# EAGLE design cpu2-b (EAGLE 4.13)
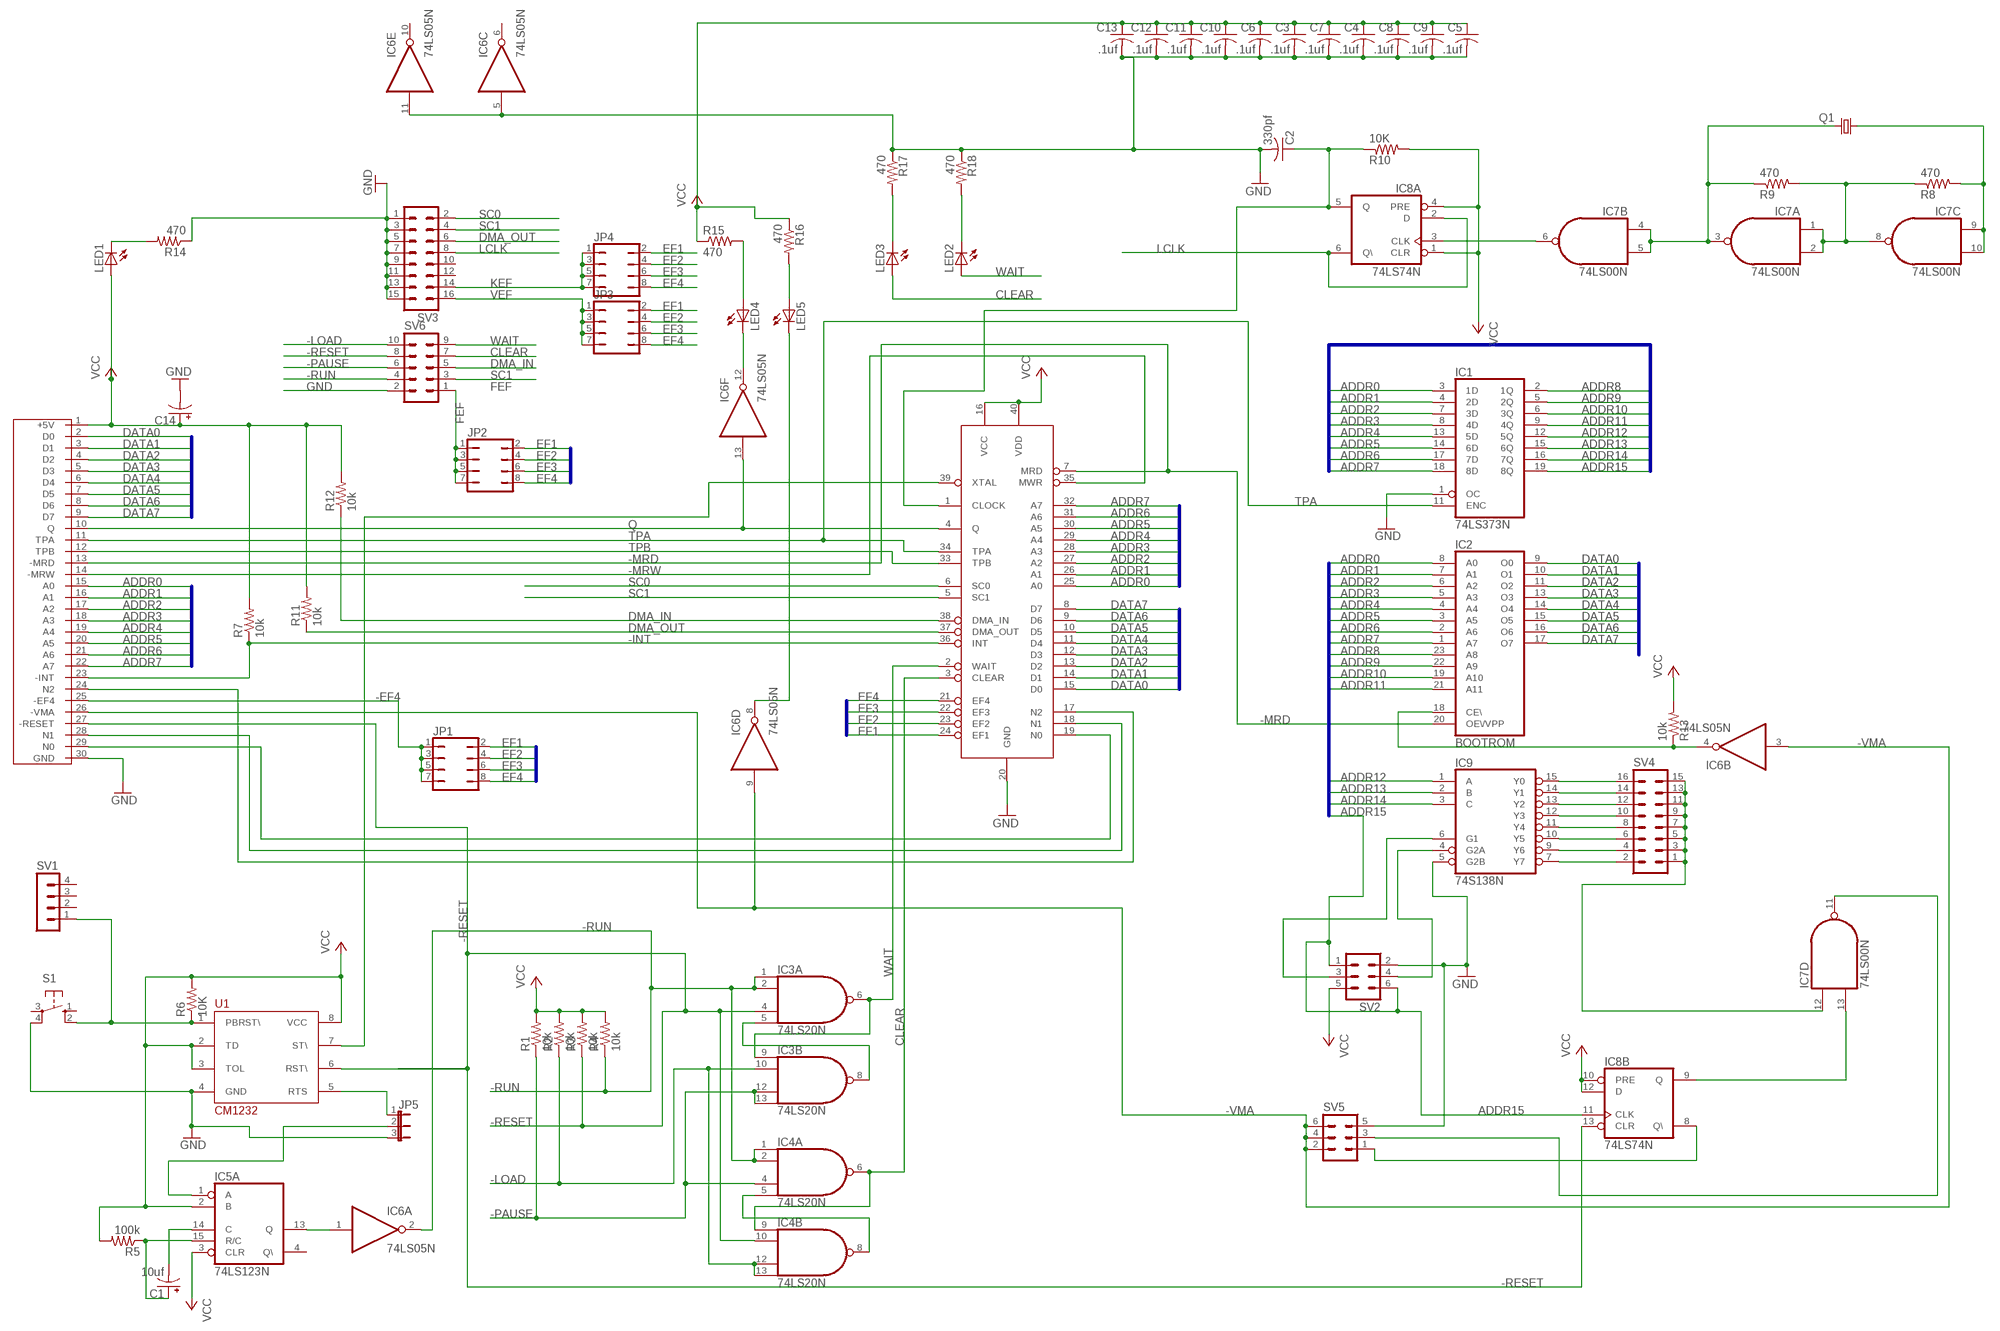
[diagram p0: schematic, sheet 1]

## Parts
C1  10uf  CPOL-USE2.5-7  [E2,5-7]
C2  330pf  C-US025-025X050  [C025-025X050]
C3  .1uf  C-US025-050X050  [C025-050X050]
C4  .1uf  C-US025-050X050  [C025-050X050]
C5  .1uf  C-US025-050X050  [C025-050X050]
C6  .1uf  C-US025-050X050  [C025-050X050]
C7  .1uf  C-US025-050X050  [C025-050X050]
C8  .1uf  C-US025-050X050  [C025-050X050]
C9  .1uf  C-US025-050X050  [C025-050X050]
C10  .1uf  C-US025-050X050  [C025-050X050]
C11  .1uf  C-US025-050X050  [C025-050X050]
C12  .1uf  C-US025-050X050  [C025-050X050]
C13  .1uf  C-US025-050X050  [C025-050X050]
C14  CPOL-USE2.5-7  [E2,5-7]
IC1  74LS373N  [DIL20]
IC2  BOOTROM  2732  [DIL24]
IC3  74LS20N  [DIL14]
IC4  74LS20N  [DIL14]
IC5  74LS123N  [DIL16]
IC6  74LS05N  [DIL14]
IC7  74LS00N  [DIL14]
IC8  74LS74N  [DIL14]
IC9  74S138N  [DIL16]
JP1  JP4Q  [JP4Q]
JP2  JP4Q  [JP4Q]
JP3  JP4Q  [JP4Q]
JP4  JP4Q  [JP4Q]
JP5  JP2E  [JP2]
LED1  LED5MM  [LED5MM]
LED2  LED5MM  [LED5MM]
LED3  LED5MM  [LED5MM]
LED4  LED5MM  [LED5MM]
LED5  LED5MM  [LED5MM]
Q1  CRYTALHC49U70  [HC49U70]
R1  10k  R-US_0207/2V  [0207/2V]
R2  10k  R-US_0207/2V  [0207/2V]
R3  10k  R-US_0207/2V  [0207/2V]
R4  10k  R-US_0207/2V  [0207/2V]
R5  100k  R-US_0207/2V  [0207/2V]
R6  10K  R-US_0207/2V  [0207/2V]
R7  10k  R-US_0207/2V  [0207/2V]
R8  470  R-US_0207/2V  [0207/2V]
R9  470  R-US_0207/2V  [0207/2V]
R10  10K  R-US_0207/2V  [0207/2V]
R11  10k  R-US_0207/2V  [0207/2V]
R12  10k  R-US_0207/2V  [0207/2V]
R13  10k  R-US_0207/2V  [0207/2V]
R14  470  R-US_0207/7  [0207/7]
R15  470  R-US_0207/7  [0207/7]
R16  470  R-US_0207/7  [0207/7]
R17  470  R-US_0207/7  [0207/7]
R18  470  R-US_0207/7  [0207/7]
S1  10-XX  [B3F-10XX]
SV1  MA04-1  [MA04-1]
SV2  MA03-2  [MA03-2]
SV3  MA08-2  [MA08-2]
SV4  MA08-2  [MA08-2]
SV5  MA03-2  [MA03-2]
SV6  MA05-2  [MA05-2]
U1  CM1232  [DIP-8]
U$1  CDP1802BCECDP1802BCE  [DIL40]
U$2  C30  [C30]

## Nets
-EF4: JP1.1 JP1.3 JP1.5 JP1.7 U$2.25(-EF4)
-INT: R7.1 U$1.36(INT) U$2.23(-INT)
-LOAD: IC3.10(B:I1) IC4.12(B:I2) IC4.13(B:I3) R2.1 SV6.10
-MRD: IC2.20(OE\/VPP) U$1.7(MRD) U$2.13(-MRD)
-MRW: U$1.35(MWR) U$2.14(-MRW)
-PAUSE: IC3.12(B:I2) IC3.13(B:I3) IC4.4(A:I2) R1.1 SV6.6
-RESET: IC3.4(A:I2) IC4.10(B:I1) IC8.13(B:CLR) R3.1 SV6.8 U1.6(RST\) U$2.27(-RESET)
-RUN: IC3.1(A:I0) IC3.2(A:I1) IC4.1(A:I0) IC4.2(A:I1) IC6.2(A:O) R4.1 SV6.4
-VMA: IC6.3(B:I) IC6.9(D:I) SV5.2 SV5.4 SV5.6 U$2.26(-VMA)
ADDR0: IC1.3(1D) IC2.8(A0) U$1.25(A0) U$2.15(A0)
ADDR1: IC1.4(2D) IC2.7(A1) U$1.26(A1) U$2.16(A1)
ADDR2: IC1.7(3D) IC2.6(A2) U$1.27(A2) U$2.17(A2)
ADDR3: IC1.8(4D) IC2.5(A3) U$1.28(A3) U$2.18(A3)
ADDR4: IC1.13(5D) IC2.4(A4) U$1.29(A4) U$2.19(A4)
ADDR5: IC1.14(6D) IC2.3(A5) U$1.30(A5) U$2.20(A5)
ADDR6: IC1.17(7D) IC2.2(A6) U$1.31(A6) U$2.21(A6)
ADDR7: IC1.18(8D) IC2.1(A7) U$1.32(A7) U$2.22(A7)
ADDR8: IC1.2(1Q) IC2.23(A8)
ADDR9: IC1.5(2Q) IC2.22(A9)
ADDR10: IC1.6(3Q) IC2.19(A10)
ADDR11: IC1.9(4Q) IC2.21(A11)
ADDR12: IC1.12(5Q) IC9.1(A)
ADDR13: IC1.15(6Q) IC9.2(B)
ADDR14: IC1.16(7Q) IC9.3(C)
ADDR15: IC1.19(8Q) IC8.11(B:CLK) SV2.1 SV2.6
CLEAR: IC4.6(A:O) IC4.9(B:I0) LED3.A SV6.7 U$1.3(CLEAR)
DATA0: IC2.9(O0) U$1.15(D0) U$2.2(D0)
DATA1: IC2.10(O1) U$1.14(D1) U$2.3(D1)
DATA2: IC2.11(O2) U$1.13(D2) U$2.4(D2)
DATA3: IC2.13(O3) U$1.12(D3) U$2.5(D3)
DATA4: IC2.14(O4) U$1.11(D4) U$2.6(D4)
DATA5: IC2.15(O5) U$1.10(D5) U$2.7(D5)
DATA6: IC2.16(O6) U$1.9(D6) U$2.8(D6)
DATA7: IC2.17(O7) U$1.8(D7) U$2.9(D7)
DMA_IN: R12.1 SV6.5 U$1.38(DMA_IN)
DMA_OUT: R11.1 SV3.6 U$1.37(DMA_OUT)
EF1: JP1.2 JP2.2 JP3.2 JP4.2 U$1.24(EF1)
EF2: JP1.4 JP2.4 JP3.4 JP4.4 U$1.23(EF2)
EF3: JP1.6 JP2.6 JP3.6 JP4.6 U$1.22(EF3)
EF4: JP1.8 JP2.8 JP3.8 JP4.8 U$1.21(EF4)
FEF: JP2.1 JP2.3 JP2.5 JP2.7 SV6.1
GND: C2.2 C3.2 C4.2 C5.2 C6.2 C7.2 C8.2 C9.2 C10.2 C11.2 C12.2 C13.2 C14.- IC1.1(OC) IC6.5(C:I) IC6.11(E:I) IC9.5(G2B) JP5.3 R14.1 R17.1 R18.1 S1.4(P1) SV2.2 SV3.1 SV3.3 SV3.5 SV3.7 SV3.9 SV3.11 SV3.13 SV3.15 SV5.5 SV6.2 U1.4(GND) U$1.20(GND) U$2.30(GND)
KEF: JP4.1 JP4.3 JP4.5 JP4.7 SV3.14
LCLK: IC8.2(A:D) IC8.6(A:Q\) SV3.8
N0: U$1.19(N0) U$2.29(N0)
N1: U$1.18(N1) U$2.28(N1)
N2: U$1.17(N2) U$2.24(N2)
N$1: IC7.11(D:O) SV5.3
N$2: R6.1 S1.2(S1) SV1.1 U1.1(PBRST\)
N$3: IC2.18(CE\) IC6.4(B:O) R13.1
N$4: IC7.13(D:I1) IC8.9(B:Q)
N$5: LED1.K(C) R14.2
N$6: IC8.8(B:Q\) SV5.1
N$7: IC6.12(F:O) LED4.K(C)
N$8: LED4.A R15.2
N$9: LED3.K(C) R17.2
N$10: LED2.K(C) R18.2
N$11: IC5.13(A:Q) IC6.1(A:I)
N$12: IC5.1(A:A) JP5.2
N$13: LED5.A R16.2
N$14: U1.7(ST\) U$1.39(XTAL)
N$16: IC7.1(A:I0) IC7.2(A:I1) IC7.8(C:O) R8.1 R9.2
N$17: C1.+ IC5.15(A:R/C) R5.1
N$18: IC7.3(A:O) IC7.4(B:I0) IC7.5(B:I1) Q1.2 R9.1
N$19: C1.- IC5.14(A:C)
N$20: IC9.4(G2A) SV2.4
N$21: IC7.9(C:I0) IC7.10(C:I1) Q1.1 R8.2
N$22: IC3.5(A:I3) IC3.8(B:O)
N$23: IC7.6(B:O) IC8.3(A:CLK)
N$24: IC4.5(A:I3) IC4.8(B:O)
N$25: IC6.8(D:O) LED5.K(C)
N$26: JP5.1 U1.5(RTS)
N$27: C2.1 IC8.5(A:Q) R10.1 U$1.1(CLOCK)
N$29: IC9.15(Y0) SV4.16
N$30: IC9.14(Y1) SV4.14
N$31: IC9.13(Y2) SV4.12
N$32: IC9.12(Y3) SV4.10
N$33: IC9.11(Y4) SV4.8
N$34: IC9.10(Y5) SV4.6
N$35: IC9.9(Y6) SV4.4
N$36: IC9.7(Y7) SV4.2
N$37: IC7.12(D:I0) SV4.1 SV4.3 SV4.5 SV4.7 SV4.9 SV4.11 SV4.13 SV4.15
N$38: IC9.6(G1) SV2.3
Q: IC6.13(F:I) U$1.4(Q) U$2.10(Q)
SC0: SV3.2 U$1.6(SC0)
SC1: SV3.4 SV6.3 U$1.5(SC1)
TPA: IC1.11(ENC) U$1.34(TPA) U$2.11(TPA)
TPB: U$1.33(TPB) U$2.12(TPB)
VCC: C3.1 C4.1 C5.1 C6.1 C7.1 C8.1 C9.1 C10.1 C11.1 C12.1 C13.1 C14.+ IC5.2(A:B) IC5.3(A:CLR) IC8.1(A:CLR) IC8.4(A:PRE) IC8.10(B:PRE) IC8.12(B:D) LED1.A R1.2 R2.2 R3.2 R4.2 R5.2 R6.2 R7.2 R10.2 R11.2 R12.2 R13.2 R15.1 R16.1 SV2.5 U1.2(TD) U1.3(TOL) U1.8(VCC) U$1.16(VCC) U$1.40(VDD) U$2.1(+5V)
VEF: JP3.1 JP3.3 JP3.5 JP3.7 SV3.16
WAIT: IC3.6(A:O) IC3.9(B:I0) LED2.A SV6.9 U$1.2(WAIT)
Unconnected: IC5.4(A:Q\) IC5.5(B:Q) IC5.6(B:C) IC5.7(B:R/C) IC5.9(B:A) IC5.10(B:B) IC5.11(B:CLR) IC5.12(B:Q\) IC6.6(C:O) IC6.10(E:O) S1.1(S) S1.3(P) SV1.2 SV1.3 SV1.4 SV3.10 SV3.12

## Buses
DATA[0..7]
ADDR[0..15]
EF[1..4]

## Power pins joined to a net without a drawn wire
GND: IC1.10(GND) IC2.12(GND) IC3.7(P:GND) IC4.7(P:GND) IC5.8(P:GND) IC6.7(P:GND) IC7.7(P:GND) IC8.7(P:GND) IC9.8(GND)
VCC: IC1.20(VCC) IC2.24(VCC) IC3.14(P:VCC) IC4.14(P:VCC) IC5.16(P:VCC) IC6.14(P:VCC) IC7.14(P:VCC) IC8.14(P:VCC) IC9.16(VCC)

## Library data of the parts
C1 C14 = rcl:CPOL-US: POLARIZED CAPACITOR, American symbol
C2-C13 = rcl:C-US: CAPACITOR, American symbol
IC1 = 74xx-us:74*373: Octal D type transparent LATCH, edge triggered
IC2 = memory:2732: MEMORY
IC3 IC4 = 74xx-us:74*20: Dual 4-input NAND gate
IC5 = 74xx-us:74*123: Retriggerable monostable MULTIVIBRATOR
IC6 = 74xx-us:74*05: Hex INVERTER, open collector
IC7 = 74xx-us:74*00: Quad 2-input NAND gate
IC8 = 74xx-us:74*74: Dual D type positive edge triggered FLIP FLOP, preset and clear
IC9 = 74xx-us:74*138: 3-line to 8-line DECODER/DEMULTIPLEXER
JP1-JP4 = jumper:JP4Q: JUMPER
JP5 = jumper:JP2E: JUMPER
LED1-LED5 = led:LED: LED OSRAM: - CHIPLED LG R971, LG N971, LY N971, LG Q971, LY Q971, LO R971, LY R971 LH N974, LH R974 LS Q976, LO Q976, LY Q976 LO Q996 - Hyper CHIPLED LW Q18S LB Q993, LB Q99A, LB R99A - SideLED LS A670, LO A670, LY A670, LG A670, LP A670 LB A673, LV A673, LT A673, LW A673 LH A674 LY A675 LS A676, LA A676, LO A676, LY A676, LW A676 LS A679, LY A679, LG A679 - Hyper Micro SIDELED® LS Y876, LA Y876, LO Y876, LY Y876 LT Y87S - SmartLED LW L88C, LW L88S LB L89C, LB L89S, LG L890 LS L89K, LO L89K, LY L89K LS L896, LA L896, LO L896, LY L896 - TOPLED LS T670, LO T670, LY T670, LG T670, LP T670 LSG T670, LSP T670, LSY T670, LOP T670, LYG T670 LG T671, LOG T671, LSG T671 LB T673, LV T673, LT T673, LW T673 LH T674 LS T676, LA T676, LO T676, LY T676, LB T676, LH T676, LSB T676, LW T676 LB T67C, LV T67C, LT T67C, LS T67K, LO T67K, LY T67K, LW E67C LS E67B, LA E67B, LO E67B, LY E67B, LB E67C, LV E67C, LT E67C LW T67C LS T679, LY T679, LG T679 LS T770, LO T770, LY T770, LG T770, LP T770 LB T773, LV T773, LT T773, LW T773 LH T774 LS E675, LA E675, LY E675, LS T675 LS T776, LA T776, LO T776, LY T776, LB T776 LHGB T686 LT T68C, LB T68C - Hyper Mini TOPLED® LB M676 - Mini TOPLED Santana® LG M470 LS M47K, LO M47K, LY M47K Source: http://www.osram.convergy.de/
Q1 = crystal:CRYTAL: CRYSTAL
R1-R18 = rcl:R-US_: RESISTOR, American symbol
S1 = switch-omron:10-XX: OMRON SWITCH
SV1 = con-lstb:MA04-1: PIN HEADER
SV2 SV5 = con-lstb:MA03-2: PIN HEADER
SV3 SV4 = con-lstb:MA08-2: PIN HEADER
SV6 = con-lstb:MA05-2: PIN HEADER
U1 = 65xxx:CM1232: CM1232 CMOS Microprocessor Monitor
U$1 = cdp:CDP1802BCE
U$2 = k1:C30

## Board
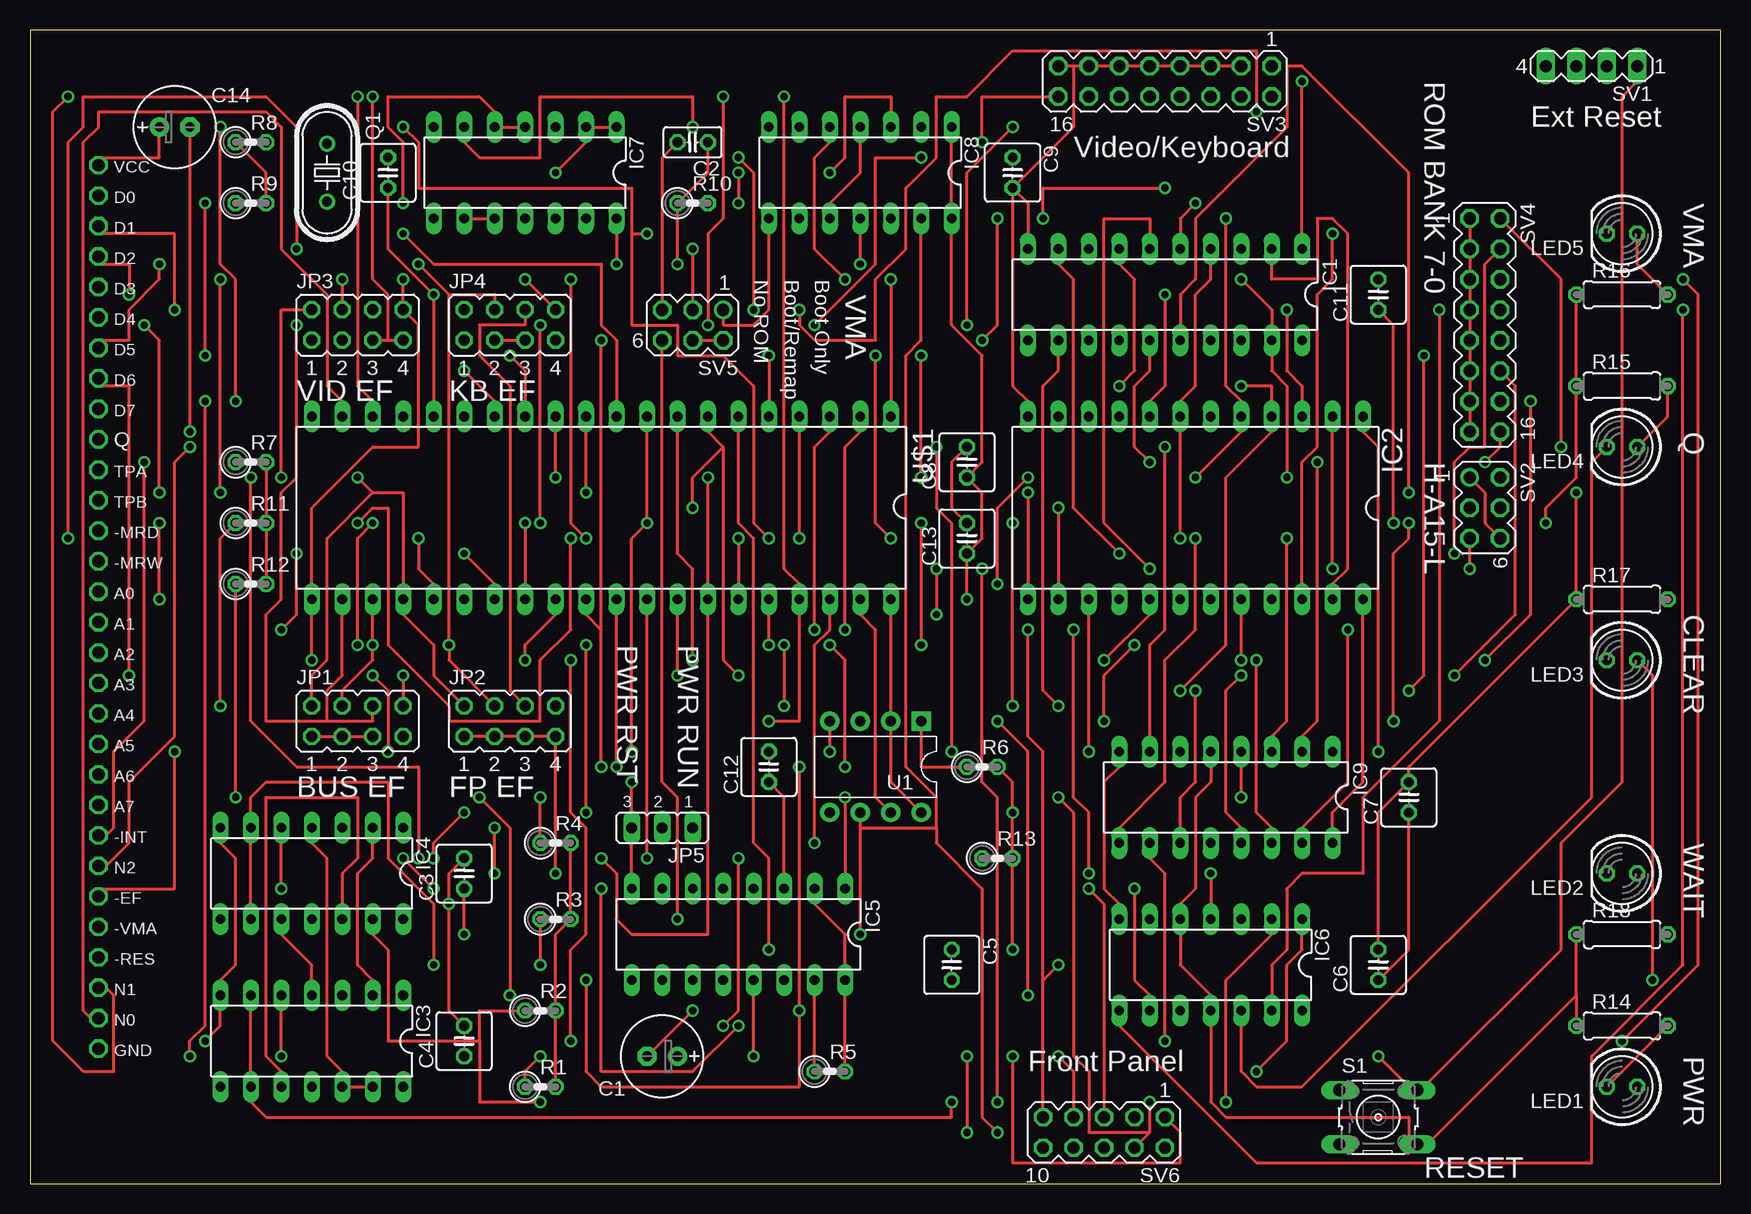
[diagram p1: board, top side]
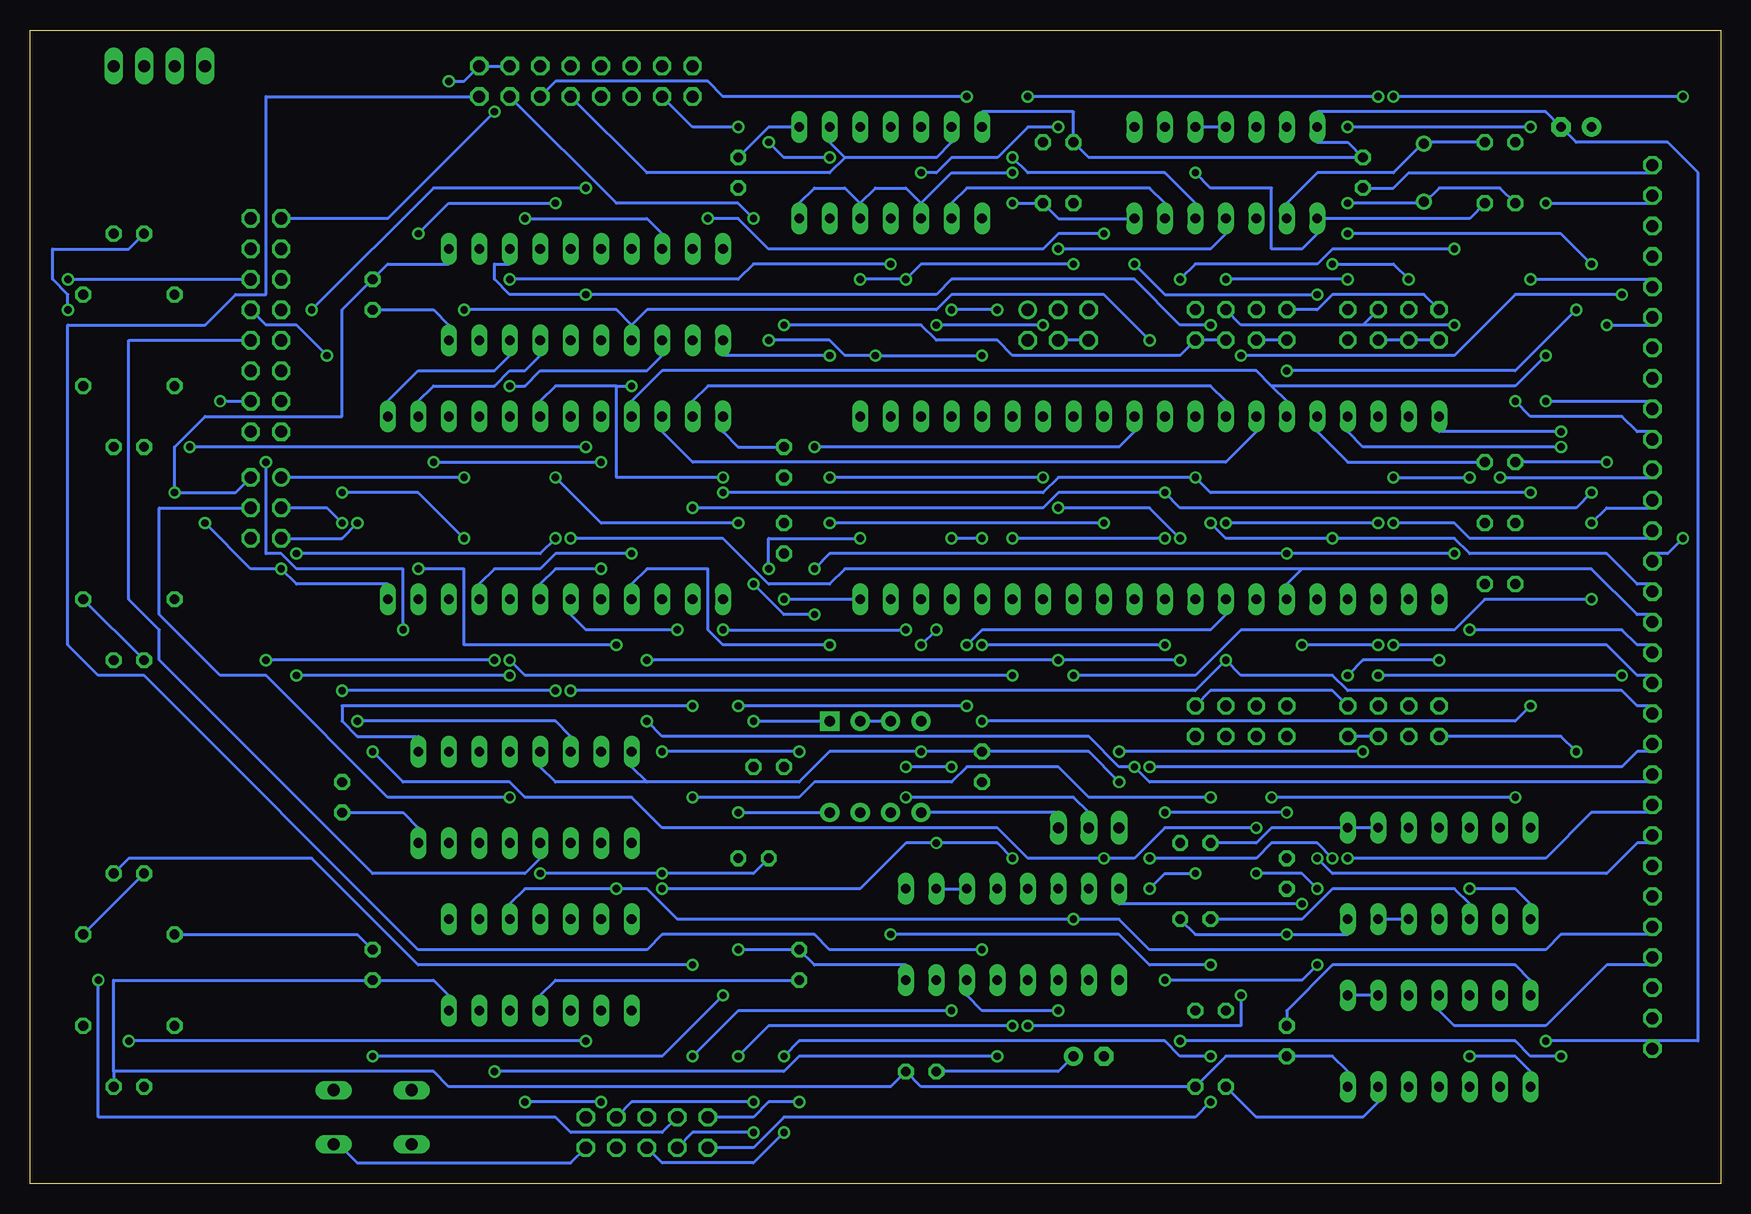
[diagram p2: board, bottom side, seen from below]

Size 140.95 x 96.19 mm. Coordinates in mm from the lower left corner, seen from the top.
Outline: 0,0 140.95,0 140.95,96.19 0,96.19 0,0
Copper layers (1*16): Top 0.035mm / dielectric 1.5mm / Bottom 0.035mm
Design rules "default": minimum track width 10mil, minimum drill 24mil, track to track 8mil, track to pad 8mil, pad to pad 8mil, via to via 8mil, smd to smd 8mil, copper to edge 40mil, drill to drill 8mil, minimum pad ring 10mil, minimum via ring 8mil, stop-mask expansion 4mil, vias tented up to drill 0mil, thermal gap 10mil
tRestrict: area 0.6,0.5 to 76.8,4.3; area 0.6,91.9 to 76.8,95.7
bRestrict: area 0.6,0.5 to 76.8,4.3; area 0.6,91.9 to 76.8,95.7

### Footprints (pad centres in the part's own frame; a part is rotated, then mirrored left to right if it is on the bottom)
E2,5-7 = drill 0.813 pad 1.6 round: + -1.27,0 | drill 0.813 pad 1.6 octagon: - 1.27,0
C025-025X050 = drill 0.813 octagon: 1 -1.27,0; 2 1.27,0
C025-050X050 = drill 0.813 octagon: 1 -1.27,0; 2 1.27,0
DIL20 = drill 0.813 long: 1 -11.43,-3.81; 2 -8.89,-3.81; 3 -6.35,-3.81; 4 -3.81,-3.81; 5 -1.27,-3.81; 6 1.27,-3.81; 7 3.81,-3.81; 8 6.35,-3.81; 9 8.89,-3.81; 10 11.43,-3.81; 11 11.43,3.81; 12 8.89,3.81; 13 6.35,3.81; 14 3.81,3.81; 15 1.27,3.81; 16 -1.27,3.81; 17 -3.81,3.81; 18 -6.35,3.81; 19 -8.89,3.81; 20 -11.43,3.81
DIL24 = drill 0.813 long: 1 -13.97,-7.62; 2 -11.43,-7.62; 3 -8.89,-7.62; 4 -6.35,-7.62; 5 -3.81,-7.62; 6 -1.27,-7.62; 7 1.27,-7.62; 8 3.81,-7.62; 9 6.35,-7.62; 10 8.89,-7.62; 11 11.43,-7.62; 12 13.97,-7.62; 13 13.97,7.62; 14 11.43,7.62; 15 8.89,7.62; 16 6.35,7.62; 17 3.81,7.62; 18 1.27,7.62; 19 -1.27,7.62; 20 -3.81,7.62; 21 -6.35,7.62; 22 -8.89,7.62; 23 -11.43,7.62; 24 -13.97,7.62
DIL14 = drill 0.813 long: 1 -7.62,-3.81; 2 -5.08,-3.81; 3 -2.54,-3.81; 4 0,-3.81; 5 2.54,-3.81; 6 5.08,-3.81; 7 7.62,-3.81; 8 7.62,3.81; 9 5.08,3.81; 10 2.54,3.81; 11 0,3.81; 12 -2.54,3.81; 13 -5.08,3.81; 14 -7.62,3.81
DIL16 = drill 0.813 long: 1 -8.89,-3.81; 2 -6.35,-3.81; 3 -3.81,-3.81; 4 -1.27,-3.81; 5 1.27,-3.81; 6 3.81,-3.81; 7 6.35,-3.81; 8 8.89,-3.81; 9 8.89,3.81; 10 6.35,3.81; 11 3.81,3.81; 12 1.27,3.81; 13 -1.27,3.81; 14 -3.81,3.81; 15 -6.35,3.81; 16 -8.89,3.81
JP4Q = drill 0.914 octagon: 1 -3.81,-1.27; 2 -3.81,1.27; 3 -1.27,-1.27; 4 -1.27,1.27; 5 1.27,-1.27; 6 1.27,1.27; 7 3.81,-1.27; 8 3.81,1.27
JP2 = drill 0.914 long: 1 -2.54,0; 2 0,0; 3 2.54,0
LED5MM = drill 0.813 octagon: A -1.27,0; K 1.27,0
HC49U70 = drill 0.813 round: 1 -2.413,0; 2 2.413,0
0207/2V = drill 0.813 octagon: 1 -1.27,0; 2 1.27,0
0207/7 = drill 0.813 octagon: 1 -3.81,0; 2 3.81,0
B3F-10XX = drill 1.016 long: 1 -3.251,2.261; 2 3.251,2.261; 3 -3.251,-2.261; 4 3.251,-2.261
MA04-1 = drill 1.016 long: 1 -3.81,0; 2 -1.27,0; 3 1.27,0; 4 3.81,0
MA03-2 = drill 1.016 round: 1 -2.54,-1.27 | drill 1.016 octagon: 2 -2.54,1.27; 3 0,-1.27; 4 0,1.27; 5 2.54,-1.27; 6 2.54,1.27
MA08-2 = drill 1.016 octagon: 1 -8.89,-1.27; 2 -8.89,1.27; 3 -6.35,-1.27; 4 -6.35,1.27; 5 -3.81,-1.27; 6 -3.81,1.27; 7 -1.27,-1.27; 8 -1.27,1.27; 9 1.27,-1.27; 10 1.27,1.27; 11 3.81,-1.27; 12 3.81,1.27; 13 6.35,-1.27; 14 6.35,1.27; 15 8.89,-1.27; 16 8.89,1.27
MA05-2 = drill 1.016 octagon: 1 -5.08,-1.27; 2 -5.08,1.27; 3 -2.54,-1.27; 4 -2.54,1.27; 5 0,-1.27; 6 0,1.27; 7 2.54,-1.27; 8 2.54,1.27; 9 5.08,-1.27; 10 5.08,1.27
DIP-8 = drill 0.889 pad 1.6 square: 1 -2.54,-2.54 | drill 0.889 pad 1.6 round: 2 0,-2.54; 3 2.54,-2.54; 4 5.08,-2.54; 5 5.08,5.08; 6 2.54,5.08; 7 0,5.08; 8 -2.54,5.08
DIL40 = drill 0.813 long: 1 -24.13,-7.62; 2 -21.59,-7.62; 3 -19.05,-7.62; 4 -16.51,-7.62; 5 -13.97,-7.62; 6 -11.43,-7.62; 7 -8.89,-7.62; 8 -6.35,-7.62; 9 -3.81,-7.62; 10 -1.27,-7.62; 11 1.27,-7.62; 12 3.81,-7.62; 13 6.35,-7.62; 14 8.89,-7.62; 15 11.43,-7.62; 16 13.97,-7.62; 17 16.51,-7.62; 18 19.05,-7.62; 19 21.59,-7.62; 20 24.13,-7.62; 21 24.13,7.62; 22 21.59,7.62; 23 19.05,7.62; 24 16.51,7.62; 25 13.97,7.62; 26 11.43,7.62; 27 8.89,7.62; 28 6.35,7.62; 29 3.81,7.62; 30 1.27,7.62; 31 -1.27,7.62; 32 -3.81,7.62; 33 -6.35,7.62; 34 -8.89,7.62; 35 -11.43,7.62; 36 -13.97,7.62; 37 -16.51,7.62; 38 -19.05,7.62; 39 -21.59,7.62; 40 -24.13,7.62
C30 = drill 1.016 octagon: 1 -36.83,0; 2 -34.29,0; 3 -31.75,0; 4 -29.21,0; 5 -26.67,0; 6 -24.13,0; 7 -21.59,0; 8 -19.05,0; 9 -16.51,0; 10 -13.97,0; 11 -11.43,0; 12 -8.89,0; 13 -6.35,0; 14 -3.81,0; 15 -1.27,0; 16 1.27,0; 17 3.81,0; 18 6.35,0; 19 8.89,0; 20 11.43,0; 21 13.97,0; 22 16.51,0; 23 19.05,0; 24 21.59,0; 25 24.13,0; 26 26.67,0; 27 29.21,0; 28 31.75,0; 29 34.29,0; 30 36.83,0

### Placement (x,y rotation side)
C1  52.7,10.63 180 top
C2  55.24,86.83 180 top
C3  36.19,25.87 90 top
C4  36.19,11.9 90 top
C5  76.83,18.25 270 top
C6  112.39,18.25 90 top
C7  114.93,32.22 90 top
C8  78.1,60.16 90 top
C9  81.91,84.29 270 top
C10  29.84,84.29 90 top
C11  112.39,74.13 90 top
C12  61.59,34.76 90 top
C13  78.1,53.81 90 top
C14  12.06,88.1 0 top
IC1  94.61,74.13 180 top
IC2  97.15,56.35 180 top
IC3  23.49,11.9 180 top
IC4  23.49,25.87 180 top
IC5  59.05,20.79 180 top
IC6  98.42,18.25 180 top
IC7  41.27,84.29 180 top
IC8  69.21,84.29 180 top
IC9  99.69,32.22 180 top
JP1  27.3,38.57 0 top
JP2  40,38.57 0 top
JP3  27.3,71.59 0 top
JP4  40,71.59 0 top
JP5  52.7,29.68 180 top
LED1  132.71,8.09 180 top
LED2  132.71,25.87 180 top
LED3  132.71,43.65 180 top
LED4  132.71,61.43 180 top
LED5  132.71,79.21 180 top
Q1  24.76,84.29 270 top
R1  42.54,8.09 0 top
R2  42.54,14.44 0 top
R3  43.81,22.06 0 top
R4  43.81,28.41 0 top
R5  66.67,9.36 0 top
R6  79.37,34.76 0 top
R7  18.41,60.16 0 top
R8  18.41,86.83 0 top
R9  18.41,81.75 0 top
R10  55.24,81.75 0 top
R11  18.41,55.08 0 top
R12  18.41,50 0 top
R13  80.64,27.14 0 top
R14  132.71,13.17 0 top
R15  132.71,66.51 0 top
R16  132.71,74.13 0 top
R17  132.71,48.73 0 top
R18  132.71,20.79 0 top
S1  112.39,5.55 0 top
SV1  130.17,93.18 180 top
SV2  121.28,56.35 270 top
SV3  94.61,91.91 180 top
SV4  121.28,71.59 270 top
SV5  55.24,71.59 180 top
SV6  89.53,4.28 180 top
U1  71.75,36.03 180 top
U$1  47.62,56.35 180 top
U$2  5.71,48.09 270 top

### Tracks (layer width: path | path; a pad name or v marks a point on that pad's centre or on a via)
-EF4  (via drill 0.61)
  Top 0.254: JP1.1 JP1.3 JP1.5 | v12.06,36.03 12.06,24.6 5.71,24.6 U$2.25
  Bottom 0.254: JP1.5 JP1.7 | v12.06,36.03 13.33,37.3 JP1.1
-INT  (via drill 0.61)
  Top 0.254: v9.52,60.16 9.52,38.57 6.98,36.03 6.98,29.68 5.71,28.41 U$2.23 | v46.35,30.95 v46.35,44.92 | v36.19,30.95 33.65,28.41 v33.65,27.14 | v61.59,44.92 U$1.36
  Bottom 0.254: v9.52,60.16 R7.1 | v46.35,44.92 v61.59,44.92 | v36.19,30.95 v46.35,30.95 | v33.65,27.14 32.38,25.87 9.52,25.87 6.98,28.41 5.71,28.41 U$2.23
-LOAD  (via drill 0.61)
  Top 0.254: IC3.10 20.95,9.36 19.68,10.63 19.68,32.22 27.3,32.22 27.3,27.14 26.03,25.87 IC4.12 | R2.1 37.46,14.44 37.46,11.9 | 37.46,11.9 29.84,11.9 29.84,19.52 28.57,20.79 IC4.13 | v42.54,6.82 37.46,6.82 37.46,11.9
  Bottom 0.254: IC4.12 IC4.13 | SV6.10 80.64,3.01 78.1,5.55 43.81,5.55 v42.54,6.82
-MRD  (via drill 0.61)
  Top 0.254: v59.05,42.38 57.78,43.65 57.78,61.43 | 57.78,61.43 56.51,62.7 U$1.7 | v100.96,43.65 IC2.20 | v27.3,55.08 28.57,56.35 29.84,56.35 29.84,44.92 34.92,39.84 34.92,38.57 42.54,38.57 42.54,43.65 45.08,46.19 v45.08,53.81 | v55.24,56.35 55.24,58.89 57.78,61.43
  Bottom 0.254: v100.96,43.65 99.69,42.38 v59.05,42.38 | v27.3,55.08 22.22,55.08 20.95,53.81 5.71,53.81 U$2.13 | v45.08,53.81 47.62,56.35 v55.24,56.35
-MRW  (via drill 0.61)
  Top 0.254: v46.35,53.81 45.08,55.08 v45.08,75.4 | v22.22,77.94 22.22,88.1 19.68,90.64 4.44,90.64 4.44,88.1 3.17,86.83 v3.17,53.81 | v59.05,53.81 U$1.35
  Bottom 0.254: v46.35,53.81 v59.05,53.81 | v45.08,75.4 43.81,76.67 33.65,76.67 32.38,77.94 v22.22,77.94 | v3.17,53.81 4.44,52.54 5.71,52.54 U$2.14
-PAUSE  (via drill 0.61)
  Top 0.254: IC3.13 IC3.12 26.03,9.36 24.76,10.63 24.76,27.14 23.49,28.41 IC4.4 | v78.1,10.63 v78.1,4.28 | v42.54,10.63 41.27,9.36 R1.1
  Bottom 0.254: R1.1 38.73,5.55 29.84,5.55 28.57,6.82 IC3.13 | SV6.6 88.26,1.74 80.64,1.74 v78.1,4.28 | v78.1,10.63 76.83,11.9 46.35,11.9 45.08,10.63 v42.54,10.63
-RESET  (via drill 0.61)
  Top 0.254: IC4.10 20.95,20.79 23.49,18.25 IC3.4 | 75.56,29.68 75.56,32.22 73.02,34.76 73.02,69.05 74.29,70.32 IC8.13 | 69.21,29.68 75.56,29.68 | 69.21,29.68 U1.6 | v80.64,4.28 79.37,5.55 79.37,24.6 75.56,28.41 75.56,29.68 | R3.1 v42.54,18.25 | v69.21,20.79 69.21,29.68
  Bottom 0.254: R3.1 34.92,22.06 32.38,24.6 22.22,24.6 20.95,23.33 IC4.10 | U$2.27 5.71,18.25 9.52,18.25 14.6,13.17 22.22,13.17 23.49,14.44 IC3.4 | SV6.8 85.72,4.28 v80.64,4.28 | v42.54,18.25 47.62,18.25 50.16,20.79 v69.21,20.79
-RUN  (via drill 0.61)
  Top 0.254: IC3.2 28.57,16.98 27.3,18.25 27.3,25.87 28.57,27.14 IC4.2 | v99.69,6.82 99.69,16.98 103.5,20.79 IC6.2 | 93.34,4.28 v93.34,6.82 | 93.34,4.28 SV6.4 | R4.1 v42.54,32.22 | v85.72,32.22 86.99,30.95 86.99,10.63 88.26,9.36 88.26,4.28 93.34,4.28
  Bottom 0.254: IC3.2 IC3.1 | IC4.2 IC4.1 37.46,29.68 38.73,28.41 R4.1 | v93.34,6.82 v99.69,6.82 | v42.54,32.22 52.7,32.22 55.24,34.76 62.86,34.76 64.13,33.49 75.56,33.49 76.83,32.22 v85.72,32.22
-VMA  (via drill 0.61)
  Top 0.254: SV5.4 SV5.2 | v92.07,24.6 92.07,16.98 93.34,15.71 IC6.9 | SV5.6 52.7,33.49 53.97,32.22 v53.97,22.06
  Bottom 0.254: SV5.6 SV5.4 | IC6.3 100.96,23.33 99.69,24.6 v92.07,24.6 89.53,24.6 86.99,22.06 v53.97,22.06 50.16,22.06 47.62,19.52 14.6,19.52 13.33,20.79 5.71,20.79 U$2.26
ADDR0  (via drill 0.61)
  Top 0.254: v94.61,74.13 94.61,66.51 93.34,65.24 IC2.8 | v32.38,53.81 32.38,51.27 33.65,50 U$1.25 | v42.54,55.08 v42.54,71.59
  Bottom 0.254: IC1.3 100.96,76.67 102.23,76.67 102.23,75.4 100.96,74.13 v94.61,74.13 65.4,74.13 64.13,75.4 48.89,75.4 45.08,71.59 v42.54,71.59 | U$2.15 5.71,50 6.98,50 9.52,52.54 20.95,52.54 22.22,53.81 v32.38,53.81 41.27,53.81 v42.54,55.08
ADDR1  (via drill 0.61)
  Top 0.254: IC1.4 98.42,75.4 97.15,74.13 97.15,66.51 95.88,65.24 IC2.7 v95.88,53.81
  Bottom 0.254: 34.92,51.27 36.19,50 U$1.26 | 34.92,51.27 10.79,51.27 6.98,47.46 5.71,47.46 U$2.16 | v95.88,53.81 83.18,53.81 79.37,50 74.29,50 73.02,51.27 34.92,51.27
ADDR2  (via drill 0.61)
  Top 0.254: v90.8,66.51 92.07,67.78 92.07,75.4 90.8,76.67 IC1.7 | v36.19,52.54 38.73,50 U$1.27 | v22.22,52.54 22.22,47.46 v20.95,46.19 | v83.18,58.89 80.64,56.35 v80.64,50 | v75.56,51.27 v75.56,47.46
  Bottom 0.254: 92.07,66.51 v90.8,66.51 | 92.07,66.51 97.15,66.51 98.42,65.24 IC2.6 | v22.22,52.54 v36.19,52.54 74.29,52.54 v75.56,51.27 | v20.95,46.19 8.25,46.19 6.98,44.92 5.71,44.92 U$2.17 | 92.07,66.51 92.07,58.89 v83.18,58.89 | v80.64,50 78.1,47.46 v75.56,47.46
ADDR3  (via drill 0.61)
  Top 0.254: v99.69,80.48 99.69,66.51 100.96,65.24 IC2.5 100.96,62.7 v97.15,58.89 | v28.57,55.08 27.3,53.81 v27.3,44.92 | v41.27,55.08 U$1.28 | v81.91,39.84 v81.91,55.08 | v62.86,44.92 v62.86,39.84
  Bottom 0.254: v99.69,80.48 89.53,80.48 88.26,79.21 IC1.8 | v28.57,55.08 v41.27,55.08 | v27.3,44.92 9.52,44.92 6.98,42.38 5.71,42.38 U$2.18 | v97.15,58.89 93.34,55.08 v81.91,55.08 | v62.86,39.84 v81.91,39.84 | v62.86,44.92 61.59,46.19 42.54,46.19 41.27,47.46 U$1.28
ADDR4  (via drill 0.61)
  Top 0.254: v100.96,66.51 103.5,66.51 IC2.4 103.5,62.7 99.69,58.89 99.69,44.92 v95.88,41.11 | v41.27,43.65 41.27,44.92 43.81,47.46 U$1.29
  Bottom 0.254: v100.96,66.51 99.69,66.51 98.42,67.78 89.53,67.78 88.26,69.05 IC1.13 | U$2.19 5.71,39.84 6.98,39.84 8.25,41.11 31.11,41.11 32.38,42.38 40,42.38 v41.27,43.65 43.81,41.11 v95.88,41.11
ADDR5  (via drill 0.61)
  Top 0.254: v104.77,72.86 104.77,67.78 106.04,66.51 IC2.3 | 47.62,46.19 46.35,47.46 U$1.30 | v47.62,34.76 47.62,46.19 | 47.62,46.19 v47.62,70.32
  Bottom 0.254: 90.8,71.59 92.07,72.86 v104.77,72.86 | v47.62,34.76 8.25,34.76 6.98,36.03 5.71,36.03 U$2.20 | 90.8,71.59 89.53,72.86 65.4,72.86 64.13,74.13 51.43,74.13 v47.62,70.32 | 90.8,71.59 IC1.14
ADDR6  (via drill 0.61)
  Top 0.254: v48.89,34.76 U$1.31 | v92.07,44.92 89.53,42.38 v89.53,38.57 | v108.58,51.27 IC2.2
  Bottom 0.254: IC1.17 98.42,69.05 99.69,67.78 100.96,67.78 102.23,66.51 107.31,66.51 108.58,65.24 IC2.2 | U$2.21 5.71,33.49 47.62,33.49 v48.89,34.76 50.16,34.76 52.7,37.3 88.26,37.3 v89.53,38.57 | v108.58,51.27 104.77,51.27 104.77,44.92 v92.07,44.92
ADDR7  (via drill 0.61)
  Top 0.254: v112.39,36.03 112.39,61.43 111.12,62.7 IC2.1 | v51.43,27.14 U$1.32 | v31.11,27.14 v33.65,24.6 | v38.73,25.87 v38.73,29.68
  Bottom 0.254: v112.39,36.03 109.85,33.49 100.96,33.49 99.69,32.22 90.8,32.22 88.26,29.68 60.32,29.68 57.78,27.14 v51.43,27.14 48.89,27.14 46.35,29.68 v38.73,29.68 | IC1.18 100.96,69.05 102.23,67.78 108.58,67.78 111.12,65.24 IC2.1 | v31.11,27.14 14.6,27.14 10.79,30.95 5.71,30.95 U$2.22 | v33.65,24.6 34.92,25.87 v38.73,25.87
ADDR8
  Top 0.254: IC2.23 108.58,50 109.85,51.27 109.85,79.21 108.58,80.48 107.31,80.48 107.31,75.4 103.5,75.4 IC1.2
ADDR9  (via drill 0.61)
  Top 0.254: v108.58,79.21 108.58,75.4 107.31,74.13 107.31,61.43 106.04,60.16 IC2.22 | v97.15,81.75 95.88,80.48 IC1.5
  Bottom 0.254: v108.58,79.21 106.04,81.75 v97.15,81.75
ADDR10  (via drill 0.61)
  Top 0.254: v93.34,51.27 89.53,55.08 89.53,80.48 93.34,80.48 IC1.6
  Bottom 0.254: v93.34,51.27 97.15,51.27 98.42,50 IC2.19
ADDR11  (via drill 0.61)
  Top 0.254: v90.8,52.54 86.99,56.35 86.99,75.4 85.72,76.67 IC1.9
  Bottom 0.254: v90.8,52.54 97.15,52.54 98.42,51.27 102.23,51.27 103.5,50 IC2.21
ADDR12  (via drill 0.61)
  Top 0.254: v85.72,39.84 84.45,41.11 84.45,66.51 85.72,67.78 IC1.12
  Bottom 0.254: v85.72,39.84 114.93,39.84 114.93,38.57 113.66,37.3 108.58,37.3 IC9.1
ADDR13  (via drill 0.61)
  Top 0.254: v107.31,60.16 107.31,38.57 106.04,37.3 IC9.2 | v93.34,60.16 92.07,61.43 92.07,66.51 93.34,67.78 IC1.15
  Bottom 0.254: v107.31,60.16 v93.34,60.16
ADDR14  (via drill 0.61)
  Top 0.254: v104.77,53.81 104.77,38.57 103.5,37.3 IC9.3 | v114.93,57.62 114.93,84.29 106.04,93.18 104.77,93.18 104.77,88.1 97.15,80.48 97.15,75.4 95.88,74.13 IC1.16
  Bottom 0.254: v104.77,53.81 108.58,57.62 v114.93,57.62
ADDR15  (via drill 0.61)
  Top 0.254: SV2.6 121.28,55.08 121.28,57.62 SV2.1 | v100.96,75.4 103.5,72.86 IC1.19 103.5,67.78 104.77,66.51 v104.77,58.89 | v69.21,76.67 IC8.11
  Bottom 0.254: v69.21,76.67 80.64,76.67 81.91,75.4 v100.96,75.4 | v104.77,58.89 SV2.1
CLEAR  (via drill 0.61)
  Top 0.254: IC4.9 IC4.6 18.41,32.22 19.68,33.49 29.84,33.49 29.84,27.14 33.65,23.33 v33.65,18.25 | v65.4,46.19 65.4,61.43 66.67,62.7 U$1.3 | v66.67,44.92 67.94,43.65 v67.94,34.76 | v64.13,34.76 v64.13,14.44 64.13,8.09 47.62,8.09 46.35,9.36 v46.35,16.98 | v85.72,10.63 86.99,9.36 SV6.7 | LED3.A 135.25,42.38 v135.25,16.98
  Bottom 0.254: v66.67,44.92 v65.4,46.19 | v64.13,34.76 v67.94,34.76 | v64.13,14.44 81.91,14.44 v85.72,10.63 | v135.25,16.98 135.25,5.55 97.15,5.55 95.88,4.28 88.26,4.28 SV6.7 | v33.65,18.25 34.92,16.98 v46.35,16.98
DATA0  (via drill 0.61)
  Top 0.254: v14.6,69.05 v14.6,81.75
  Bottom 0.254: 37.46,66.51 38.73,67.78 88.26,67.78 90.8,65.24 IC2.9 | 37.46,66.51 36.19,65.24 U$1.15 | v14.6,81.75 5.71,81.75 U$2.2 | v14.6,69.05 17.14,66.51 37.46,66.51
DATA1  (via drill 0.61)
  Top 0.254: v12.06,72.86 12.06,79.21 5.71,79.21 U$2.3 | v36.19,67.78 38.73,65.24 U$1.14
  Bottom 0.254: U$1.14 38.73,62.7 41.27,60.16 85.72,60.16 88.26,62.7 IC2.10 | v12.06,72.86 17.14,67.78 v36.19,67.78
DATA2  (via drill 0.61)
  Top 0.254: v8.25,74.13 8.25,76.67 5.71,76.67 U$2.4 | v40,69.05 41.27,67.78 U$1.13
  Bottom 0.254: U$1.13 41.27,65.24 42.54,66.51 84.45,66.51 85.72,65.24 IC2.11 | v8.25,74.13 17.14,74.13 22.22,69.05 v40,69.05
DATA3  (via drill 0.61)
  Top 0.254: v43.81,58.89 U$1.12 | v83.18,57.62 IC2.13 | v15.87,57.62 v15.87,75.4
  Bottom 0.254: v83.18,57.62 56.51,57.62 55.24,58.89 v43.81,58.89 42.54,57.62 v15.87,57.62 | v15.87,75.4 5.71,75.4 U$2.5
DATA4  (via drill 0.61)
  Top 0.254: v46.35,57.62 U$1.11 | v85.72,56.35 IC2.14 | v9.52,71.59 10.79,70.32 v10.79,57.62
  Bottom 0.254: v85.72,56.35 56.51,56.35 55.24,57.62 v46.35,57.62 45.08,56.35 12.06,56.35 v10.79,57.62 | v9.52,71.59 5.71,71.59 U$2.6
DATA5  (via drill 0.61)
  Top 0.254: v76.83,36.03 76.83,55.08 75.56,56.35 v75.56,61.43 | v88.26,36.03 IC2.15 | v10.79,76.67 10.79,75.4 8.25,72.86 8.25,70.32 5.71,70.32 U$2.7 | v31.11,79.21 33.65,76.67 47.62,76.67 47.62,71.59 48.89,70.32 U$1.10
  Bottom 0.254: v76.83,36.03 v88.26,36.03 | v75.56,61.43 50.16,61.43 48.89,62.7 U$1.10 | v10.79,76.67 13.33,79.21 v31.11,79.21
DATA6  (via drill 0.61)
  Top 0.254: v74.29,55.08 v74.29,44.92 | U$1.9 v51.43,55.08 50.16,53.81 v50.16,36.03 | v8.25,42.38 8.25,66.51 5.71,66.51 U$2.8 | v28.57,42.38 29.84,41.11 v29.84,36.03
  Bottom 0.254: v51.43,55.08 v74.29,55.08 | v74.29,44.92 83.18,44.92 84.45,46.19 84.45,51.27 89.53,51.27 90.8,50 IC2.16 | v8.25,42.38 v28.57,42.38 | v29.84,36.03 v50.16,36.03
DATA7  (via drill 0.61)
  Top 0.254: v55.24,43.65 55.24,51.27 53.97,52.54 U$1.8 | v89.53,43.65 93.34,47.46 IC2.17 | v14.6,65.24 14.6,13.17 13.33,11.9 v13.33,10.63 | v45.08,11.9 45.08,19.52 46.35,20.79 46.35,29.68 45.08,30.95 v45.08,43.65
  Bottom 0.254: v89.53,43.65 v55.24,43.65 v45.08,43.65 | v14.6,65.24 5.71,65.24 U$2.9 | v13.33,10.63 15.87,10.63 17.14,11.9 v45.08,11.9
DMA_IN  (via drill 0.61)
  Top 0.254: v17.14,32.22 R12.1 | v37.46,32.22 40,29.68 v40,15.71 | v57.78,13.17 59.05,14.44 v59.05,27.14 | v65.4,28.41 65.4,44.92 66.67,46.19 U$1.38 | SV6.5 89.53,23.33 v88.26,24.6
  Bottom 0.254: v17.14,32.22 v37.46,32.22 | v40,15.71 40,13.17 v57.78,13.17 | v59.05,27.14 60.32,28.41 v65.4,28.41 67.94,28.41 71.75,24.6 v88.26,24.6
DMA_OUT  (via drill 0.61)
  Top 0.254: v62.86,90.64 62.86,51.27 64.13,50 U$1.37 64.13,38.57 v61.59,38.57 | R11.1 15.87,53.81 v15.87,39.84
  Bottom 0.254: v62.86,90.64 83.18,90.64 84.45,91.91 97.15,91.91 SV3.6 | v15.87,39.84 17.14,38.57 v61.59,38.57
EF1  (via drill 0.61)
  Top 0.254: JP2.2 33.65,42.38 33.65,44.92 31.11,47.46 U$1.24 31.11,57.62 28.57,57.62 | JP1.2 23.49,42.38 24.76,43.65 24.76,53.81 28.57,57.62 | JP3.2 20.95,72.86 v20.95,58.89 | 28.57,57.62 v27.3,58.89
  Bottom 0.254: JP3.2 24.76,74.13 32.38,74.13 33.65,72.86 JP4.2 | v27.3,58.89 v20.95,58.89
EF2  (via drill 0.61)
  Top 0.254: JP1.4 26.03,41.11 28.57,43.65 v28.57,44.92 U$1.23 | JP2.4 34.92,43.65 v34.92,44.92 34.92,74.13 | 34.92,74.13 38.73,74.13 JP4.4 | v26.03,75.4 JP3.4 | 34.92,74.13 v32.38,76.67
  Bottom 0.254: v26.03,75.4 27.3,76.67 v32.38,76.67 | v28.57,44.92 v34.92,44.92
EF3  (via drill 0.61)
  Top 0.254: 24.76,38.57 24.76,41.11 26.03,42.38 U$1.22 | 24.76,38.57 28.57,38.57 JP1.6 | JP2.6 40,41.11 40,66.51 37.46,69.05 37.46,71.59 41.27,71.59 JP4.6 | 24.76,38.57 19.68,38.57 19.68,47.46 20.95,48.73 20.95,57.62 22.22,58.89 v22.22,71.59
  Bottom 0.254: 29.84,71.59 JP3.6 | 29.84,71.59 40,71.59 JP4.6 | v22.22,71.59 29.84,71.59
EF4  (via drill 0.61)
  Top 0.254: v41.27,75.4 JP4.8 | v31.11,75.4 JP3.8 32.38,71.59 32.38,61.43 28.57,61.43 23.49,56.35 U$1.21 v23.49,43.65 | v31.11,42.38 JP1.8
  Bottom 0.254: JP1.8 32.38,41.11 42.54,41.11 JP2.8 | v31.11,75.4 v41.27,75.4 | v31.11,42.38 29.84,43.65 v23.49,43.65
FEF  (via drill 0.61)
  Top 0.254: JP2.1 JP2.3 JP2.5 JP2.7 v43.81,25.87 | SV6.1 95.88,4.28 95.88,1.74 81.91,1.74 v81.91,10.63 | v59.05,13.17 55.24,9.36 47.62,9.36 v47.62,24.6
  Bottom 0.254: v81.91,10.63 79.37,13.17 v59.05,13.17 | v47.62,24.6 46.35,25.87 v43.81,25.87
GND  (via drill 0.61)
  Top 0.254: SV5.5 52.7,85.56 C2.2 | C14.- v13.33,62.7 | C13.2 76.83,56.35 76.83,60.16 C8.2 | C9.2 83.18,81.75 IC1.10 | 86.99,93.18 SV3.13 SV3.11 SV3.9 SV3.7 SV3.5 SV3.3 | 86.99,93.18 SV3.15 | C9.2 86.99,88.1 86.99,93.18 | C9.2 81.91,66.51 83.18,65.24 IC2.12 | IC4.7 15.87,28.41 17.14,27.14 17.14,18.25 15.87,16.98 IC3.7 15.87,13.17 v14.6,11.9 | IC5.8 JP5.3 v50.16,33.49 | C4.2 34.92,14.44 v34.92,23.33 34.92,25.87 C3.2 | IC6.7 90.8,23.33 89.53,24.6 89.53,33.49 90.8,34.76 IC9.8 | v66.67,36.03 U1.4 | IC9.5 98.42,33.49 97.15,32.22 97.15,24.6 95.88,23.33 IC6.5 95.88,18.25 98.42,15.71 IC6.11 98.42,6.82 99.69,5.55 114.93,5.55 114.93,3.01 S1.4 116.2,3.01 128.9,15.71 | C6.2 112.39,30.95 C7.2 114.93,34.76 R17.1 v128.9,57.62 | 128.9,15.71 R18.1 | 128.9,15.71 R14.1 | IC1.1 v106.04,91.91
  Bottom 0.254: IC8.7 61.59,89.37 53.97,89.37 C2.2 52.7,85.56 C10.2 31.11,86.83 33.65,86.83 IC7.7 33.65,89.37 14.6,89.37 C14.- 12.06,86.83 4.44,86.83 1.9,84.29 1.9,11.9 5.71,11.9 | v13.33,62.7 23.49,62.7 U$1.20 | C8.2 81.91,61.43 83.18,62.7 IC2.12 | SV3.3 SV3.1 104.77,91.91 v106.04,91.91 | 5.71,11.9 v14.6,11.9 | v34.92,23.33 50.16,23.33 IC5.8 | C4.2 36.19,14.44 32.38,18.25 17.14,18.25 15.87,16.98 IC3.7 | C5.2 97.15,16.98 98.42,15.71 IC6.11 | 89.53,33.49 76.83,33.49 74.29,36.03 v66.67,36.03 C12.2 52.7,36.03 v50.16,33.49 | 89.53,33.49 90.8,34.76 IC9.8 | 89.53,33.49 97.15,33.49 98.42,34.76 IC9.5 | SV6.2 95.88,1.74 113.66,1.74 114.93,3.01 S1.4 | IC1.1 106.04,76.67 111.12,76.67 C11.2 114.93,72.86 114.93,63.97 126.36,63.97 128.9,61.43 v128.9,57.62 123.82,57.62 SV2.2 | C6.2 113.66,20.79 R18.1 | 5.71,11.9 U$2.30
KEF  (via drill 0.61)
  Top 0.254: JP4.3 JP4.5 | v81.91,88.1 78.1,84.29 v78.1,71.59
  Bottom 0.254: JP4.1 JP4.3 | JP4.5 JP4.7 45.08,69.05 59.05,69.05 60.32,70.32 65.4,70.32 66.67,71.59 v78.1,71.59 | SV3.14 85.72,88.1 v81.91,88.1
LCLK
  Bottom 0.254: 73.02,85.56 65.4,85.56 64.13,86.83 IC8.6 | 73.02,85.56 74.29,86.83 IC8.2 | SV3.8 89.53,84.29 74.29,84.29 73.02,85.56
N0
  Top 0.254: U$1.19 26.03,65.24 24.76,66.51 24.76,74.13 20.95,77.94 20.95,88.1 19.68,89.37 5.71,89.37 5.71,88.1 4.44,86.83 4.44,14.44 5.71,13.17 U$2.29
N1  (via drill 0.61)
  Top 0.254: v27.3,90.64 27.3,66.51 28.57,65.24 U$1.18 | v3.17,90.64 1.9,89.37 1.9,11.9 4.44,9.36 6.98,9.36 6.98,15.71 5.71,16.98 U$2.28
  Bottom 0.254: v3.17,90.64 v27.3,90.64
N2  (via drill 0.61)
  Top 0.254: v13.33,61.43 12.06,60.16 12.06,37.3 8.25,33.49 8.25,28.41 5.71,25.87 U$2.24
  Bottom 0.254: v13.33,61.43 29.84,61.43 31.11,62.7 U$1.17
N$1  (via drill 0.61)
  Top 0.254: v55.24,77.94 SV5.3
  Bottom 0.254: v55.24,77.94 42.54,77.94 41.27,79.21 IC7.11
N$2  (via drill 0.61)
  Top 0.254: R6.1 74.29,34.76 U1.1 | SV1.1 133.98,91.91 132.71,90.64 132.71,33.49 127.63,28.41 127.63,19.52 116.2,8.09 S1.2 114.93,8.09 v112.39,10.63 | v80.64,38.57 83.18,36.03 v83.18,15.71
  Bottom 0.254: v80.64,38.57 U1.1 | v83.18,15.71 88.26,10.63 v112.39,10.63
N$3  (via drill 0.61)
  Top 0.254: v98.42,25.87 IC6.4 | v86.99,46.19 86.99,32.22 88.26,30.95 v88.26,25.87
  Bottom 0.254: R13.1 80.64,25.87 v88.26,25.87 v98.42,25.87 | v86.99,46.19 94.61,46.19 95.88,47.46 IC2.18
N$4
  Bottom 0.254: IC7.13 46.35,81.75 47.62,83.02 62.86,83.02 64.13,81.75 IC8.9
N$5
  Top 0.254: LED1.K R14.2
N$6
  Top 0.254: SV5.1 57.78,71.59 60.32,71.59 61.59,72.86 IC8.8
N$7
  Top 0.254: LED4.K 130.17,60.16 130.17,32.22 106.04,8.09 102.23,8.09 100.96,9.36 IC6.12
N$8
  Top 0.254: LED4.A 136.52,63.97 R15.2
N$9
  Bottom 0.254: LED3.K R17.2
N$10
  Bottom 0.254: LED2.K R18.2
N$11  (via drill 0.61)
  Top 0.254: v102.23,9.36 104.77,11.9 104.77,18.25 106.04,19.52 IC6.1 | v60.32,10.63 IC5.13
  Bottom 0.254: v60.32,10.63 76.83,10.63 78.1,9.36 v102.23,9.36
N$12  (via drill 0.61)
  Top 0.254: v67.94,32.22 IC5.1
  Bottom 0.254: v67.94,32.22 53.97,32.22 52.7,30.95 JP5.2
N$13
  Top 0.254: R16.2 133.98,76.67 LED5.A
N$14
  Top 0.254: U1.7 70.48,32.22 70.48,46.19 69.21,47.46 U$1.39
N$16  (via drill 0.61)
  Top 0.254: IC7.1 IC7.2 46.35,86.83 v43.81,84.29 | R8.1 19.68,84.29 R9.2
  Bottom 0.254: R9.2 20.95,80.48 IC7.8 33.65,79.21 34.92,77.94 37.46,77.94 37.46,83.02 42.54,83.02 v43.81,84.29
N$17
  Top 0.254: R5.1 IC5.15
  Bottom 0.254: C1.+ 55.24,9.36 R5.1
N$18  (via drill 0.61)
  Top 0.254: IC7.4 IC7.5 38.73,89.37 37.46,90.64 29.84,90.64 29.84,88.1 31.11,86.83 v31.11,81.75
  Bottom 0.254: IC7.4 IC7.3 | R9.1 18.41,83.02 23.49,83.02 24.76,81.75 | 24.76,81.75 v31.11,81.75 | 24.76,81.75 Q1.2
N$19  (via drill 0.61)
  Top 0.254: C1.- v55.24,14.44
  Bottom 0.254: v55.24,14.44 61.59,14.44 62.86,15.71 IC5.14
N$20  (via drill 0.61)
  Top 0.254: v100.96,32.22 IC9.4
  Bottom 0.254: v100.96,32.22 111.12,32.22 121.28,42.38 125.09,42.38 130.17,47.46 130.17,56.35 SV2.4
N$21
  Top 0.254: IC7.9 IC7.10
  Bottom 0.254: R8.2 24.76,86.83 | 24.76,86.83 27.3,84.29 33.65,84.29 36.19,81.75 IC7.9 | 24.76,86.83 Q1.1
N$22  (via drill 0.61)
  Top 0.254: v20.95,10.63 IC3.5
  Bottom 0.254: v20.95,10.63 17.14,10.63 15.87,9.36 IC3.8
N$23  (via drill 0.61)
  Top 0.254: v55.24,88.1 55.24,90.64 42.54,90.64 42.54,85.56 37.46,85.56 36.19,86.83 IC7.6 | v66.67,84.29 67.94,85.56 67.94,90.64 71.75,90.64 IC8.3
  Bottom 0.254: v55.24,88.1 57.78,88.1 60.32,85.56 64.13,85.56 65.4,84.29 v66.67,84.29
N$24  (via drill 0.61)
  Top 0.254: v20.95,24.6 IC4.5
  Bottom 0.254: v20.95,24.6 17.14,24.6 15.87,23.33 IC4.8
N$25  (via drill 0.61)
  Top 0.254: v137.79,72.86 137.79,18.25 130.17,10.63 130.17,1.74 102.23,1.74 90.8,13.17 IC6.8
  Bottom 0.254: v137.79,72.86 137.79,74.13 139.06,75.4 139.06,77.94 132.71,77.94 LED5.K
N$26
  Bottom 0.254: U1.5 55.24,30.95 JP5.1
N$27  (via drill 0.61)
  Top 0.254: C2.1 56.51,84.29 R10.1 v53.97,76.67 | v67.94,75.4 65.4,77.94 65.4,85.56 66.67,86.83 IC8.5 | v71.75,75.4 U$1.1
  Bottom 0.254: v71.75,75.4 v67.94,75.4 66.67,76.67 v53.97,76.67
N$29  (via drill 0.61)
  Top 0.254: v109.85,46.19 109.85,33.49 106.04,29.68 IC9.15 | v121.28,60.16 122.55,61.43 SV4.16
  Bottom 0.254: v109.85,46.19 109.85,51.27 118.74,51.27 120.01,52.54 121.28,52.54 v121.28,60.16
N$30  (via drill 0.61)
  Top 0.254: v102.23,43.65 102.23,30.95 103.5,29.68 IC9.14 | v121.28,43.65 125.09,47.46 v125.09,65.24
  Bottom 0.254: v102.23,43.65 v121.28,43.65 | v125.09,65.24 SV4.14
N$31  (via drill 0.61)
  Top 0.254: v100.96,42.38 99.69,41.11 99.69,30.95 100.96,29.68 IC9.13 | v118.74,42.38 123.82,47.46 123.82,66.51 SV4.12
  Bottom 0.254: v100.96,42.38 v118.74,42.38
N$32
  Bottom 0.254: SV4.10 132.71,70.32 132.71,48.73 130.17,46.19 130.17,43.65 112.39,25.87 99.69,25.87 98.42,27.14 IC9.12
N$33  (via drill 0.61)
  Top 0.254: v97.15,41.11 97.15,33.49 95.88,32.22 IC9.11 | v114.93,41.11 116.2,42.38 v116.2,69.05
  Bottom 0.254: v97.15,41.11 v114.93,41.11 | v116.2,69.05 118.74,71.59 121.28,71.59 SV4.8
N$34  (via drill 0.61)
  Top 0.254: v94.61,11.9 94.61,25.87 93.34,27.14 IC9.10 | v132.71,11.9 139.06,18.25 139.06,74.13 v137.79,75.4
  Bottom 0.254: v94.61,11.9 v132.71,11.9 | v137.79,75.4 SV4.6
N$35  (via drill 0.61)
  Top 0.254: v97.15,53.81 97.15,46.19 94.61,43.65 94.61,33.49 90.8,29.68 IC9.9 | v118.74,52.54 118.74,60.16 120.01,61.43 121.28,61.43 121.28,76.67 SV4.4
  Bottom 0.254: v97.15,53.81 98.42,52.54 v118.74,52.54
N$36  (via drill 0.61)
  Top 0.254: v94.61,61.43 94.61,46.19 93.34,44.92 IC9.7 | v127.63,61.43 127.63,75.4 SV4.2
  Bottom 0.254: v94.61,61.43 v127.63,61.43
N$37  (via drill 0.61)
  Top 0.254: SV4.15 SV4.13 SV4.11 SV4.9 SV4.7 SV4.5 SV4.3 SV4.1 | v59.05,85.56 60.32,84.29 v60.32,72.86 | v64.13,72.86 64.13,71.59 65.4,70.32 70.48,70.32 70.48,75.4 73.02,77.94 73.02,83.02 75.56,85.56 75.56,90.64 78.1,90.64 81.91,94.45 102.23,94.45 v102.23,89.37
  Bottom 0.254: v59.05,85.56 57.78,84.29 46.35,84.29 43.81,81.75 IC7.12 | v60.32,72.86 v64.13,72.86 | v102.23,89.37 111.12,80.48 SV4.1
N$38  (via drill 0.61)
  Top 0.254: v113.66,38.57 113.66,52.54 114.93,53.81 v114.93,55.08
  Bottom 0.254: v113.66,38.57 97.15,38.57 95.88,37.3 IC9.6 | v114.93,55.08 116.2,56.35 SV2.3
Q  (via drill 0.61)
  Top 0.254: v61.59,53.81 60.32,55.08 60.32,66.51 57.78,69.05 53.97,69.05 53.97,71.59 50.16,71.59 50.16,79.21 | 50.16,79.21 50.16,83.02 32.38,83.02 32.38,86.83 v31.11,88.1 | v15.87,88.1 15.87,76.67 17.14,75.4 v17.14,65.24 | v64.13,53.81 U$1.4 | v117.47,72.86 117.47,38.57 111.12,32.22 111.12,25.87 106.04,25.87 104.77,24.6 104.77,19.52 103.5,18.25 IC6.13 | v94.61,83.02 84.45,83.02 v84.45,80.48 | 50.16,79.21 v51.43,79.21
  Bottom 0.254: v61.59,53.81 v64.13,53.81 | v15.87,88.1 v31.11,88.1 | v17.14,65.24 15.87,63.97 8.25,63.97 6.98,62.7 5.71,62.7 U$2.10 | v117.47,72.86 107.31,83.02 v94.61,83.02 | v84.45,80.48 81.91,80.48 79.37,77.94 56.51,77.94 55.24,79.21 v51.43,79.21
SC0  (via drill 0.61)
  Top 0.254: v61.59,19.52 61.59,27.14 60.32,28.41 60.32,53.81 59.05,55.08 U$1.6
  Bottom 0.254: v61.59,19.52 74.29,19.52 75.56,20.79 88.26,20.79 89.53,19.52 108.58,19.52 131.44,42.38 135.25,42.38 137.79,44.92 137.79,71.59 126.36,71.59 123.82,74.13 121.28,74.13 121.28,90.64 SV3.2
SC1  (via drill 0.61)
  Top 0.254: v79.37,70.32 80.64,71.59 v80.64,80.48 | v61.59,69.05 U$1.5 | v80.64,6.82 80.64,32.22 79.37,33.49 v79.37,51.27 | v71.75,53.81 70.48,55.08 v70.48,69.05
  Bottom 0.254: v61.59,69.05 v70.48,69.05 73.02,69.05 74.29,70.32 v79.37,70.32 | v80.64,80.48 81.91,81.75 92.07,81.75 SV3.4 | SV6.3 90.8,6.82 v80.64,6.82 | v79.37,51.27 79.37,53.81 v71.75,53.81
TPA  (via drill 0.61)
  Top 0.254: v74.29,58.89 v74.29,69.05 | v56.51,58.89 U$1.34 56.51,20.79 50.16,20.79 48.89,22.06 48.89,25.87 v47.62,27.14 | v18.41,58.89 18.41,38.57 22.22,34.76 32.38,34.76 v32.38,27.14
  Bottom 0.254: v56.51,58.89 v74.29,58.89 | v74.29,69.05 83.18,69.05 IC1.11 | v18.41,58.89 5.71,58.89 U$2.11 | v32.38,27.14 33.65,28.41 37.46,28.41 38.73,27.14 v47.62,27.14
TPB  (via drill 0.61)
  Top 0.254: v10.79,48.73 v10.79,55.08 | v53.97,42.38 U$1.33
  Bottom 0.254: v53.97,42.38 43.81,42.38 40,46.19 22.22,46.19 19.68,48.73 v10.79,48.73 | v10.79,55.08 9.52,56.35 5.71,56.35 U$2.12
VCC  (via drill 0.61)
  Top 0.254: C14.+ 10.79,85.56 5.71,85.56 U$2.1 | R12.2 R11.2 R7.2 | C10.1 29.84,77.94 v33.65,74.13 U$1.16 | IC7.14 v48.89,76.67 | R6.2 81.91,33.49 v81.91,30.95 R13.2 v81.91,19.52 | U$1.40 U1.2 71.75,33.49 U1.8 | IC8.10 66.67,81.75 69.21,84.29 IC8.4 | IC8.1 IC8.14 76.83,71.59 79.37,69.05 79.37,60.16 C8.1 79.37,57.62 79.37,53.81 C13.1 v78.1,48.73 | R1.2 R2.2 43.81,20.79 R3.2 R4.2 | v36.19,20.79 C3.1 | C12.1 62.86,32.22 IC5.3 | R5.2 IC5.16 67.94,20.79 65.4,23.33 IC5.2 | R16.1 R15.1 128.9,58.89 126.36,56.35 v126.36,55.08 | IC2.24 111.12,33.49 108.58,30.95 IC9.16 | v120.01,51.27 SV2.5 | C11.1 113.66,71.59 v113.66,55.08 | C6.1 114.93,19.52 C7.1 | v59.05,84.29 v59.05,81.75
  Bottom 0.254: IC7.14 55.24,80.48 R10.2 v59.05,81.75 | R7.2 31.11,60.16 33.65,62.7 U$1.16 | v48.89,76.67 46.35,74.13 v33.65,74.13 | C10.1 27.3,83.02 26.03,84.29 5.71,84.29 U$2.1 | U1.2 U1.3 | v81.91,30.95 U1.8 | 71.75,81.75 70.48,83.02 67.94,83.02 66.67,81.75 | C9.1 79.37,88.1 IC8.1 | 71.75,81.75 73.02,83.02 75.56,83.02 76.83,81.75 IC8.14 | 71.75,81.75 IC8.12 | U$1.40 v78.1,48.73 | IC3.14 31.11,9.36 32.38,10.63 C4.1 41.27,10.63 R1.2 66.67,8.09 R5.2 69.21,8.09 106.04,8.09 107.31,9.36 133.98,9.36 | R3.2 43.81,20.79 v36.19,20.79 31.11,20.79 IC4.14 | IC5.2 IC5.3 | IC5.16 67.94,18.25 75.56,18.25 C5.1 v81.91,19.52 | 133.98,9.36 133.98,16.98 C6.1 107.31,16.98 106.04,15.71 IC6.14 | 133.98,9.36 LED1.A | C11.1 107.31,72.86 106.04,71.59 IC1.20 | C7.1 109.85,30.95 108.58,29.68 IC9.16 | IC2.24 111.12,50 118.74,50 v120.01,51.27 122.55,51.27 v126.36,55.08 | v113.66,55.08 114.93,53.81 SV2.5 | v59.05,84.29 64.13,84.29 66.67,81.75 | 66.67,81.75 IC8.10
VEF  (via drill 0.61)
  Top 0.254: 29.84,70.32 JP3.7 | JP3.5 29.84,70.32 | SV3.16 79.37,90.64 v79.37,86.83 | v74.29,85.56 70.48,85.56 70.48,76.67 v65.4,71.59 | v56.51,71.59 56.51,79.21 57.78,80.48 v57.78,90.64 | v28.57,90.64 28.57,75.4 29.84,74.13 29.84,70.32
  Bottom 0.254: JP3.1 JP3.3 JP3.5 | v79.37,86.83 78.1,85.56 v74.29,85.56 | v56.51,71.59 v65.4,71.59 | v28.57,90.64 v57.78,90.64
WAIT  (via drill 0.61)
  Top 0.254: IC3.6 IC3.9 18.41,6.82 19.68,5.55 76.83,5.55 v76.83,6.82 | 84.45,16.98 v85.72,18.25 | SV6.9 84.45,16.98 | v67.94,46.19 67.94,61.43 69.21,62.7 U$1.2 | v83.18,46.19 83.18,37.3 84.45,36.03 84.45,16.98
  Bottom 0.254: LED2.A 132.71,27.14 117.47,27.14 108.58,18.25 v85.72,18.25 | v83.18,46.19 v67.94,46.19 | v76.83,6.82 79.37,6.82 80.64,5.55 SV6.9

### Text on the board
tNames: ROM BANK 7-0 | Ext Reset | Video/Keyboard | VMA | No ROM | Boot/Remap | Boot Only | VMA | VID EF | KB EF | Q | H-A15-L | CLEAR | PWR RST | PWR RUN | BUS EF | FP EF | WAIT | PWR | Front Panel | RESET